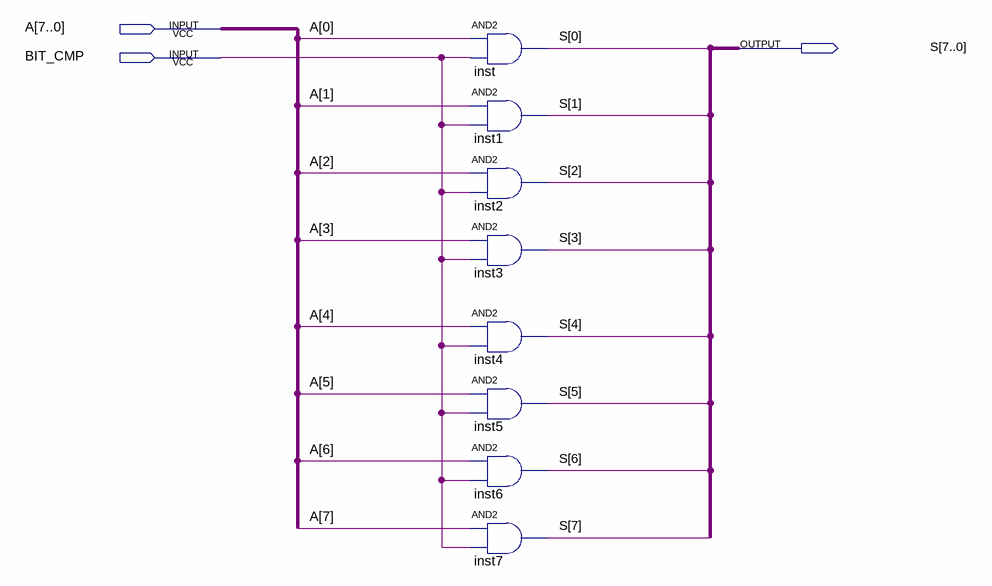
[diagram p0: schematic sheet]
// Quartus schematic AND_8bit.bdf as structural Verilog: 8 symbols, 3 pins
module AND_8bit (
  input  [7:0] A,
  input  BIT_CMP,
  output [7:0] S
);

  and inst (S[0], A[0], BIT_CMP);
  and inst1 (S[1], A[1], BIT_CMP);
  and inst2 (S[2], A[2], BIT_CMP);
  and inst3 (S[3], A[3], BIT_CMP);
  and inst4 (S[4], A[4], BIT_CMP);
  and inst5 (S[5], A[5], BIT_CMP);
  and inst6 (S[6], A[6], BIT_CMP);
  and inst7 (S[7], A[7], BIT_CMP);
endmodule
